# Altium project roverSwitch.PrjPcb (part 2 of 2)

## Sheet Power.SchDoc
size A4; DrawnBy: Emile Renaud; Revision: V1.0; SheetNumber: 2; SheetTotal: 8
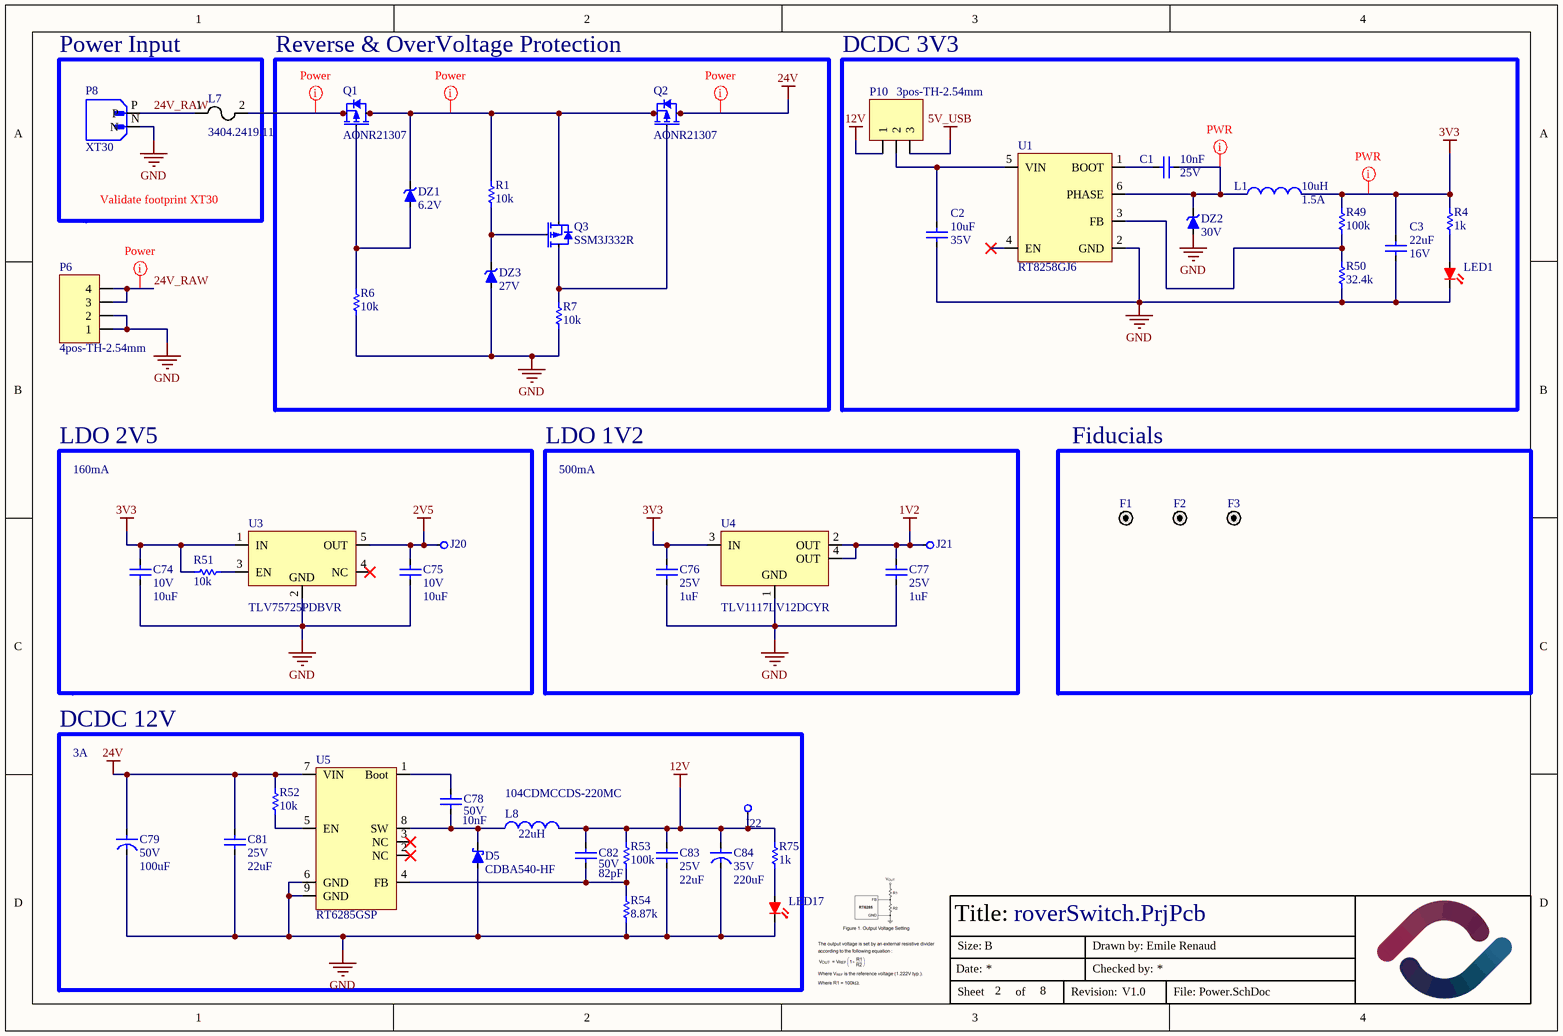
[diagram p6: Power.SchDoc]

### Parts
C1  value 10nF  Volt: 25V  [CAPACITOR-0603]  (hidden comment: Capacitor-0603-10nF-25V-X5R)
C2  value 10uF  Volt: 35V  [CAPACITOR-0805]  (hidden comment: Capacitor-0805-10uF-35V-X5R)
C3  value 22uF  Volt: 16V  [CAPACITOR-0805]  (hidden comment: Capacitor-0805-22uF-16V-X5R)
C74  value 10uF  Volt: 10V  [CAPACITOR-0603]  (hidden comment: Capacitor-0603-10uF-10V-X5R)
C75  value 10uF  Volt: 10V  [CAPACITOR-0603]  (hidden comment: Capacitor-0603-10uF-10V-X5R)
C76  value 1uF  Volt: 25V  [CAPACITOR-0603]  (hidden comment: Capacitor-0603-1uF-25V-X5R)
C77  value 1uF  Volt: 25V  [CAPACITOR-0603]  (hidden comment: Capacitor-0603-1uF-25V-X5R)
C78  value 10nF  Volt: 50V  [CAPACITOR-0603]  (hidden comment: Capacitor-0603-10nF-50V-X7R)
C79  value 100uF  Volt: 50V  [CAP_J-V_8X10P5_RUB]  (hidden comment: CAP ALUM 100UF 20% 25V SMD)
C81  value 22uF  Volt: 25V  [CAPACITOR-0805]  (hidden comment: Capacitor-0805-22uF-25V-X5R)
C82  value 82pF  Volt: 50V  [CAPACITOR-0603]  (hidden comment: Capacitor-0603-82pF-50V-C0G)
C83  value 22uF  Volt: 25V  [CAPACITOR-0805]  (hidden comment: Capacitor-0805-22uF-25V-X5R)
C84  value 220uF  Volt: 35V  [CAP_J-V_8X10P5_RUB]  (hidden comment: CAP ALUM 220UF 20% 35V SMD)
D5  CDBA540-HF  [SMA/DO-214AC]
DZ1  Volt: 6.2V  [SOD-123]  (hidden comment: BZT52C6V2-TP)
DZ2  Volt: 30V  [DO-219AD]  (hidden comment: MSS1P3L-M3/89A)
DZ3  Volt: 27V  [SOD-123F]  (hidden comment: MMSZ5254B-TP)
F1  F  [Fiducial_JLCPCB]  (value not drawn)
F2  F  [Fiducial_JLCPCB]  (value not drawn)
F3  F  [Fiducial_JLCPCB]  (value not drawn)
J20  hole  [PAD-0.53MM]  (value not drawn)  (no BOM)
J21  hole  [PAD-0.53MM]  (value not drawn)  (no BOM)
J22  hole  [PAD-0.53MM]  (value not drawn)  (no BOM)
L1  value 10uH  Current: 1.5A  [INDUCTOR_ASPI-4030S-100M]  (hidden comment: ASPI-4030S-100M-T)
L7  3404.2419.11  [2-SMD-Fuse]
L8  104CDMCCDS-220MC  value 22uH  [Inductor_22UH 5A]
LED1  B1911USD-20D000114U1930  [LED-0603-2PIN]  (value not drawn)
LED17  B1911USD-20D000114U1930  [LED-0603-2PIN]  (value not drawn)
P6  4pos-TH-2.54mm  [HDR1X4]
P8  XT30  [XT30PW_smd]
P10  3pos-TH-2.54mm  [HDR1X3]
Q1  AONR21307  [DFN8_3x3_Power]
Q2  AONR21307  [DFN8_3x3_Power]
Q3  SSM3J332R  [SOT-23-3]
R1  value 10k  [Resistor-0603]  (hidden comment: SMT resistor)
R4  value 1k  [Resistor-0603]  (hidden comment: SMT resistor)
R6  value 10k  [Resistor-0603]  (hidden comment: SMT resistor)
R7  value 10k  [Resistor-0603]  (hidden comment: SMT resistor)
R49  value 100k  [Resistor-0603]  (hidden comment: SMT resistor)
R50  value 32.4k  [Resistor-0603]  (hidden comment: SMT resistor)
R51  value 10k  [Resistor-0603]  (hidden comment: SMT resistor)
R52  value 10k  [Resistor-0603]  (hidden comment: SMT resistor)
R53  value 100k  [Resistor-0603]  (hidden comment: SMT resistor)
R54  value 8.87k  [Resistor-0603]  (hidden comment: SMT resistor)
R75  value 1k  [Resistor-0603]  (hidden comment: SMT resistor)
U1  RT8258GJ6  [SOT-23-6]
U3  TLV75725PDBVR  [SOT-23-5]
U4  TLV1117LV12DCYR  [SOT-223-3/TO-261-3S]
U5  RT6285GSP  [SOIC-8-EXPOSED-PAD]

### Blocks framed on the sheet
Power Input: L7 P8
Reverse & OverVoltage Protection: DZ1 DZ3 Q1-Q3 R1 R6 R7
DCDC 3V3: C1-C3 DZ2 L1 LED1 P10 R4 R49 R50 U1
LDO 2V5: C74 C75 J20 R51 U3
LDO 1V2: C76 C77 J21 U4
Fiducials: F1-F3
DCDC 12V: C78 C79 C81-C84 D5 J22 L8 LED17 R52-R54 R75 U5

### Nets
1V2: C77.2 J21.1 U4.2(OUT) U4.4(OUT)
2V5: C75.1 J20.1 U3.5(OUT)
3V3: C3.2 C74.1 C76.2 L1.2 R4.2 R49.2 R51.2 U3.1(IN) U4.3(IN)
5V_USB: P10.3
12V: C82.2 C83.2 C84.1 J22.1 L8.2 P10.1 R53.2 R75.2
24V: C79.1 C81.2 Q2.5(D) Q2.6(D) Q2.7(D) Q2.8(D) R52.2 U5.7(VIN)
GND: C2.1 C3.1 C74.2 C75.2 C76.1 C77.1 C79.2 C81.1 C83.1 C84.2 D5.1(A) DZ2.2(A) DZ3.1(A) LED1.1(K) LED17.1(K) P6.1 P6.2 P8.N R6.1 R7.1 R50.1 R54.1 U1.2(GND) U3.2(GND) U4.1(GND) U5.6(GND) U5.9(GND)
24V_RAW: L7.1 P6.3 P6.4 P8.P
NetC1_1: C1.1 U1.1(BOOT)
NetC1_2: C1.2 DZ2.1(K) L1.1 U1.6(PHASE)
NetC2_2: C2.2 P10.2 U1.5(VIN)
NetC78_1: C78.1 D5.2(K) L8.1 U5.8(SW)
NetC78_2: C78.2 U5.1(Boot)
NetC82_1: C82.1 R53.1 R54.2 U5.4(FB)
NetDZ1_1: DZ1.1(A) Q1.4(G) R6.2
NetDZ1_2: DZ1.2(K) Q1.5(D) Q1.6(D) Q1.7(D) Q1.8(D) Q2.1(S) Q2.2(S) Q2.3(S) Q3.2(S) R1.2
NetDZ3_2: DZ3.2(K) Q3.1(G) R1.1
NetL7_2: L7.2 Q1.1(S) Q1.2(S) Q1.3(S)
NetLED1_2: LED1.2(R) R4.1
NetLED17_2: LED17.2(R) R75.1
NetQ2_4: Q2.4(G) Q3.3(D) R7.2
NetR49_1: R49.1 R50.2 U1.3(FB)
NetR51_1: R51.1 U3.3(EN)
NetR52_1: R52.1 U5.5(EN)

Not connected (* = marked no-connect by the designer): U1 4(EN)*; U3 4(NC)*; U5 2(NC)* 3(NC)*

### Layout directives
net class Power: 3V3, 24V, 24V_RAW, NetC1_2, NetDZ1_2, NetL7_2

### Notes on the sheet
- Validate footprint XT30
- 160mA
- 500mA
- 3A
- Title:
- Date:
- Size:
- B
- Drawn by:
- Checked by:
- Sheet
- of
- Revision:
- File:

### Library data of the parts
C1 = Capacitor-0603-10nF-25V-X5R: 10000 pF ±10% 25V Ceramic Capacitor X5R 0603 (1608 Metric); Precision: X5R-10%; Mounted: Yes; Package / Case: Metric 1608 , EIA 0603; Supplier 1: Digikey; Supplier Part Number 1: 478-KGM15AR51E103KTCT-ND
C2 = Capacitor-0805-10uF-35V-X5R: Precision: X5R-10%; Package / Case: Metric 2012 , EIA 0805; Mounted: Yes; Supplier 1: Digi-Key; Supplier Part Number 1: 490-10515-1-ND; Supplier 2: Digi-Key; Supplier 3: Digi-Key; Supplier 4: Digi-Key
C3 = Capacitor-0805-22uF-16V-X5R: Precision: X5R-10%; Package / Case: Metric 2012 , EIA 0805; Mounted: Yes; Supplier 1: Digi-Key; Supplier Part Number 1: 1276-6780-1-ND; Supplier 2: Digi-Key; Supplier 3: Digi-Key; Supplier 4: Digi-Key
C74 C75 = Capacitor-0603-10uF-10V-X5R: 10 µF ±20% 10V Ceramic Capacitor X5R 0603 (1608 Metric); Supplier 1: Digikey; Supplier Part Number 1: 4713-GMC10X5R106M10NTCT-ND; Mounted: Yes; Package / Case: Metric 1608 , EIA 0603; Precision: 20%
C76 C77 = Capacitor-0603-1uF-25V-X5R: Precision: X5R-10%; Package / Case: Metric 1608, EIA 0603; Mounted: Yes; Supplier 1: Digi-Key; Supplier Part Number 1: 1276-1859-2-ND; Supplier 2: Digi-Key; Supplier Part Number 2: 1276-1942-2-ND
C78 = Capacitor-0603-10nF-50V-X7R: Precision: X7R-10%; Mounted: Yes; Package / Case: Metric 1608 , EIA 0603; Supplier 1: Digikey; Supplier Part Number 1: 490-4778-1-ND
C79 = Capacitor-100uF-50V-SMD: CAP ALUM 100UF 20% 50V SMD; Precision: 20%; Mounted: Yes; Supplier 1: Digi-Key; Supplier Part Number 1: 1189-1651-1-ND; Supplier 2: Digi-Key
C81 C83 = Capacitor-0805-22uF-25V-X5R: Precision: X5R-20%; Package / Case: Metric 2012 , EIA 0805; Mounted: Yes; Supplier 1: Digi-Key; Supplier Part Number 1: 490-12389-1-ND; Supplier 2: Digi-Key
C82 = Capacitor-0603-82pF-50V-C0G: Precision: C0G-5%; Package / Case: Metric 1608, EIA 0603; Mounted: Yes; Supplier 1: Digi-Key; Supplier Part Number 1: 478-KGM15ACG1H820JTCT-ND; Supplier 2: Digi-Key
C84 = Capacitor-220uF-35V-SMD: Precision: 20%; Mounted: Yes; Supplier 1: Digi-Key; Supplier Part Number 1: 1189-1651-1-ND; Supplier 2: Digi-Key
D5 = CDBA540-HF: DIODE SCHOTTKY 40V 5A SMA; Supplier 1: Digi-Key; Supplier Part Number 1: 641-1707-1-ND; Mounted: Yes; Package / Case: SMA; Volt: 40V
DZ1 = BZT52C6V2-TP: Zener Diode 6.2 V 200 mW ±6% Surface Mount SOD-123; Watt: 200mW; Grade: None; Package / Case: SOD-123; Supplier 1: Digi-Key; Supplier Part Number 1: BZT52C13-TPMSCT-ND; Mounted: Yes; Precision: 6%
DZ2 = MSS1P3L-M3/89A: Diode 30 V 1A Surface Mount MicroSMP (DO-219AD); Grade: None; Package / Case: DO-214AC, SMA; Supplier 1: Digi-Key; Supplier Part Number 1: MSS1P3L-M3/89AGICT-ND; Mounted: Yes
DZ3 = MMSZ5254B-TP: DIODE ZENER 27V 500MW SOD123; Watt: 0.5W; Precision: 5%; Grade: None; Package / Case: SOD-123; Supplier 1: Digi-Key; Supplier Part Number 1: MMSZ5254B-TPMSCT-ND; Mounted: Yes
F1-F3 = F?: Fiducial for JLCPCBA
J20-J22 = PAD 0.53mm AWG28-Solid: PAD for 28 AWG Solid Wire; Mounted: N/A
L1 = ASPI-4030S-100M-T: 10 µH Shielded Drum Core, Wirewound Inductor 1.5 A 100mOhm Nonstandard; Precision: 20%; Supplier 1: Digi-Key; Mounted: Yes; Supplier Part Number 1: 535-12314-2-ND; Package / Case: SMD
L7 = 3404.2419.11: 2 A 277 V AC 250 V DC Fuse Board Mount (Cartridge Style Excluded) Requires Holder, Surface Mount 2-SMD, Square End Block with Clip; Current: 2A; Supplier 1: Digi-Key; Mounted: Yes; Supplier Part Number 1: 486-2091-ND; Package / Case: SMD
L8 = 104CDMCCDS-220MC: FIXED IND 22UH 5A 66 MOHM SMD; Precision: 20%; Supplier 1: Digi-Key; Mounted: Yes; Supplier Part Number 1: 308-2498-1-ND; Package / Case: SMD; Current: 5A
LED1 LED17 = B1911USD-20D000114U1930: LED RED CLEAR 1608 SMD; Package / Case: 0603 (1608 Metric); Mounted: Yes; Supplier 1: Digi-Key; Supplier Part Number 1: 3147-B1911USD-20D000114U1930CT-ND
P6 = 4pos-TH-2.54mm: 4pos TH 2.54mm Header; Supplier 1: Digi-Key; Supplier Part Number 1: N/A; Mounted: Yes; Package / Case: TH; Volt: N/A
P8 = XT30_pcb: Supplier 1: Digi-Key; Mounted: Yes; Package / Case: TH; Volt: N/A
P10 = 3pos-TH-2.54mm: 3pos TH 2.54mm Header; Supplier 1: Digi-Key; Supplier Part Number 1: N/A; Mounted: Yes; Package / Case: TH; Volt: N/A
Q1 Q2 = AONR21307: MOSFET P-CH 30V 24A 8DFN; Supplier 1: Digi-Key; Supplier Part Number 1: 785-1796-2-ND; Volt: 30V; Package / Case: 8-DFN-EP (3x3); Mounted: Yes; Current: 24A
Q3 = SSM3J332R: P-Channel 30 V 6A (Ta) 1W (Ta) Surface Mount SOT-23F; Volt: 30V; Supplier 1: Digi-Key; Supplier Part Number 1: SSM3J332RLFCT-ND; Package / Case: SOT-523; Mounted: Yes; Current: 6A
R1 R6 R7 R51 = Resistor0603-10k: Precision: 1%; Watt: 0.1W; Mounted: Yes; Package / Case: Metric 1608, EIA 0603; Supplier 2: Digi-Key; Supplier 4: Digi-Key; Supplier Part Number 2: RMCF0603FT10K0TR-ND; Supplier 1: Digi-Key; Supplier 3: Digi-Key; Supplier Part Number 1: 311-10.0KHRTR-ND
R4 R75 = Resistor-0603-1k: Resistor0603-1k; Precision: 1%; Watt: 0.1W; Mounted: Yes; Package / Case: Metric 1608, EIA 0603; Supplier 1: Digi-Key; Supplier Part Number 1: 311-1.00KHRCT-ND
R49 R53 = Resistor-0603-100k: Resistor0603-100k; Precision: 1%; Watt: 0.1W; Mounted: Yes; Package / Case: Metric 1608, EIA 0603; Supplier 1: Digi-Key; Supplier Part Number 1: 311-100KHRCT-ND
R50 = Resistor-0603-32.4k: Resistor0603-32.4k; Precision: 1%; Watt: 0.1W; Mounted: Yes; Package / Case: Metric 1608, EIA 0603; Supplier 1: Digi-Key; Supplier Part Number 1: 311-32.4KHRCT-ND
R52 = Resistor-0603-10k: Resistor0603-10k; Precision: 1%; Watt: 0.1W; Mounted: Yes; Package / Case: Metric 1608, EIA 0603; Supplier 1: Digi-Key; Supplier Part Number 1: 311-10.0KHRTR-ND
R54 = Resistor-0603-8.87k: Resistor0603-8.87k; Precision: 1%; Watt: 0.1W; Mounted: Yes; Package / Case: Metric 1608, EIA 0603; Supplier 1: Digi-Key; Supplier Part Number 1: 311-8.87KHRCT-ND
U1 = REG_SWR_RT8258GJ6: Switching Regulator/Controller; Manufacturer: Richtek; Supplier: Mouser; Supplier Part Number: 835-RT8258GJ6; Manufacturer Part Number: RT8258GJ6; RoHS: Yes; Category: Voltage Regulators - Switching; Stock: 6840; Pricing: 1=0,64, 10=0,566, 50=0,566, 100=0,434, 1000=0,274, 10000=0,223 (USD); ComponentLink1URL: https://datasheet.ciiva.com:443/pdfs/VipMasterIC/IC/RHTK/RHTKS00677/RHTKS00677-1.pdf?src-supplier=IHS+Markit; ComponentLink1Description: https://datasheet.ciiva.com:443/pdfs/VipMasterIC/IC/RHTK/RHTKS00677/RHTKS00677-1.pdf?src-supplier=IHS+Markit; ComponentLink2URL: https://datasheet.ciiva.com/2035/3d3futf-83fb3frfm4mju4ltaylnbkzg3d3d3f3d-2035878.pdf?src-supplier=Digikey; ComponentLink2Description: https://datasheet.ciiva.com/2035/3d3futf-83fb3frfm4mju4ltaylnbkzg3d3d3f3d-2035878.pdf?src-supplier=Digikey; ComponentLink3URL: https://datasheet.ciiva.com/22686/1720507-22686356.pdf?src-supplier=Element14; ComponentLink3Description: https://datasheet.ciiva.com/22686/1720507-22686356.pdf?src-supplier=Element14
U3 = TLV75725PDBVR: IC REG 2.5V Positive Fixed 1 Output 1A SOT-23-5; Supplier 1: Digi-Key; Supplier Part Number 1: 296-50412-1-ND; Package / Case: SOT23-5; Mounted: Yes
U4 = TLV1117LV12DCYR: IC REG 1.2V LINEAR 1A SOT223; Supplier 1: Digi-Key; Supplier Part Number 1: 296-TLV1117LV12DCYRCT-ND; Package / Case: SOT223; Mounted: Yes
U5 = RT6285GSP: 5A Buck Switching Regulator IC Positive Adjustable 1.222V 1 Output 5A 8-SOIC (0.154", 3.90mm Width) Exposed Pad; Grade: None; Supplier 1: Digi-Key; Supplier Part Number 1: 1028-RT6285GSPCT-ND; HelpURL: file:///C:/Users/Emile/Downloads/DS6285-00.pdf; Package / Case: 8-SOIC-EP; Mounted: Yes

## Sheet CAN-SW.SchDoc
size A4; DrawnBy: Emile Renaud; Revision: V1.0; SheetNumber: 4; SheetTotal: 8
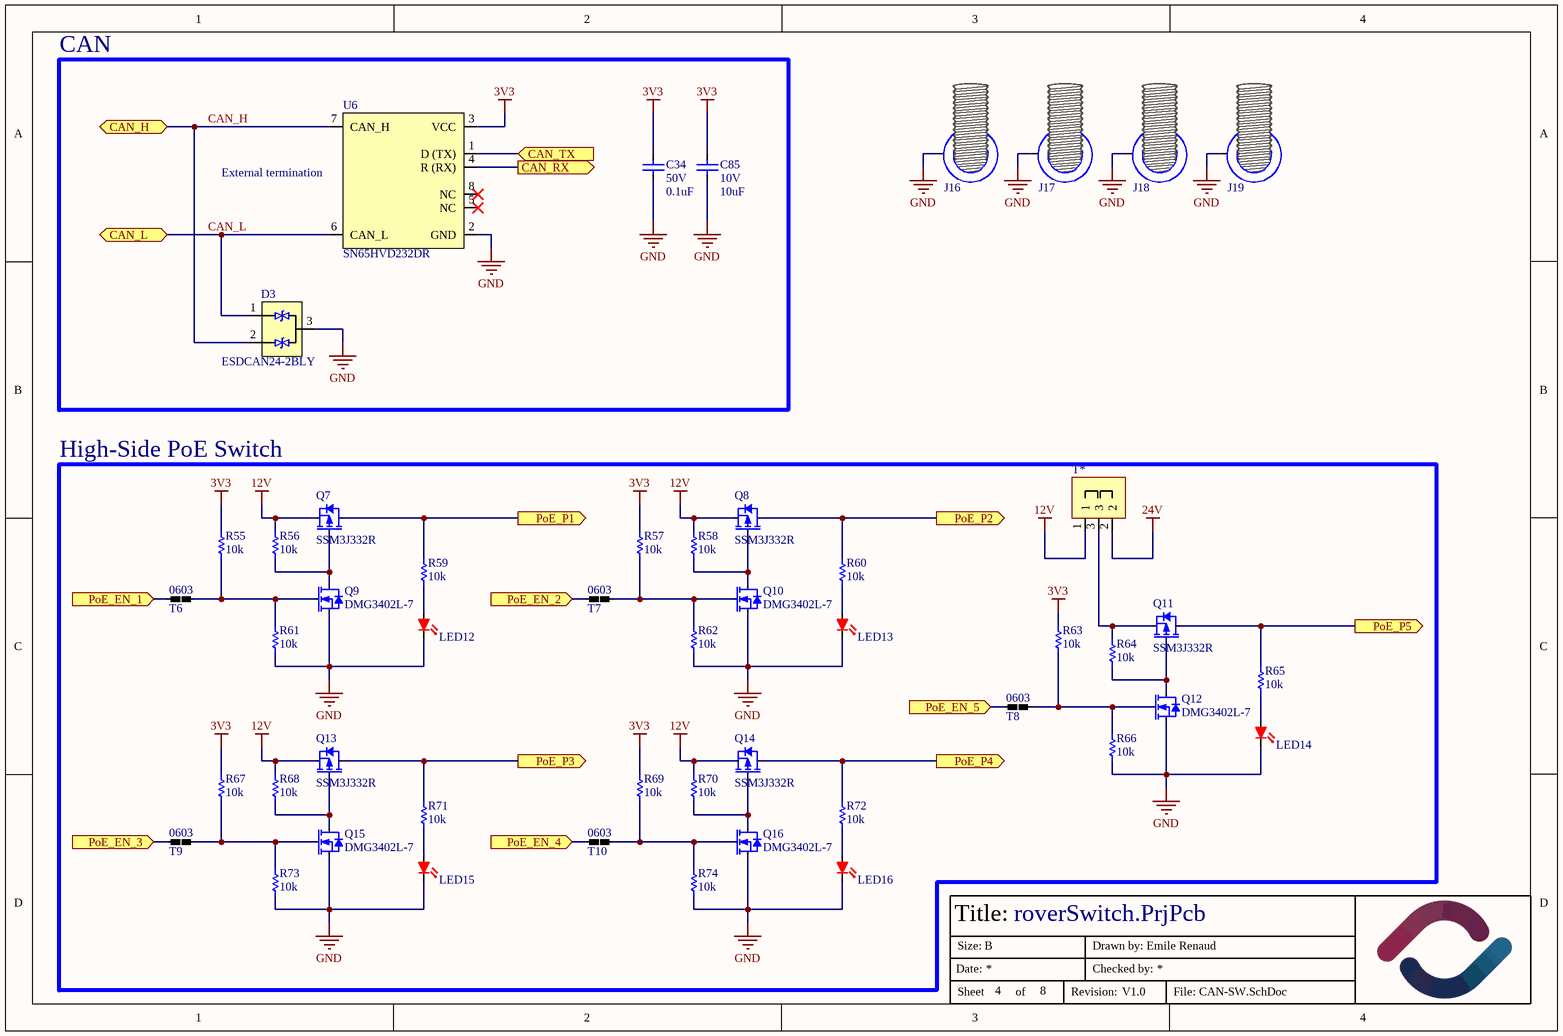
[diagram p7: CAN-SW.SchDoc]

### Parts
C34  value 0.1uF  Volt: 50V  [CAPACITOR-0603]  (hidden comment: Capacitor-0603-0.1uF-50V-X7R)
C85  value 10uF  Volt: 10V  [CAPACITOR-0603]  (hidden comment: Capacitor-0603-10uF-10V-X5R)
D3  ESDCAN24-2BLY  [SOT-23-3]
J16  hole  [HOLE-3.40MM-M3-8MMEYELET]  (value not drawn)  (no BOM)
J17  hole  [HOLE-3.40MM-M3-8MMEYELET]  (value not drawn)  (no BOM)
J18  hole  [HOLE-3.40MM-M3-8MMEYELET]  (value not drawn)  (no BOM)
J19  hole  [HOLE-3.40MM-M3-8MMEYELET]  (value not drawn)  (no BOM)
LED12  B1911USD-20D000114U1930  [LED-0603-2PIN]  (value not drawn)
LED13  B1911USD-20D000114U1930  [LED-0603-2PIN]  (value not drawn)
LED14  B1911USD-20D000114U1930  [LED-0603-2PIN]  (value not drawn)
LED15  B1911USD-20D000114U1930  [LED-0603-2PIN]  (value not drawn)
LED16  B1911USD-20D000114U1930  [LED-0603-2PIN]  (value not drawn)
Q7  SSM3J332R  [SOT-23-3]
Q8  SSM3J332R  [SOT-23-3]
Q9  DMG3402L-7  [SOT-23-3]
Q10  DMG3402L-7  [SOT-23-3]
Q11  SSM3J332R  [SOT-23-3]
Q12  DMG3402L-7  [SOT-23-3]
Q13  SSM3J332R  [SOT-23-3]
Q14  SSM3J332R  [SOT-23-3]
Q15  DMG3402L-7  [SOT-23-3]
Q16  DMG3402L-7  [SOT-23-3]
R55  value 10k  [Resistor-0603]  (hidden comment: SMT resistor)
R56  value 10k  [Resistor-0603]  (hidden comment: SMT resistor)
R57  value 10k  [Resistor-0603]  (hidden comment: SMT resistor)
R58  value 10k  [Resistor-0603]  (hidden comment: SMT resistor)
R59  value 10k  [Resistor-0603]  (hidden comment: SMT resistor)
R60  value 10k  [Resistor-0603]  (hidden comment: SMT resistor)
R61  value 10k  [Resistor-0603]  (hidden comment: SMT resistor)
R62  value 10k  [Resistor-0603]  (hidden comment: SMT resistor)
R63  value 10k  [Resistor-0603]  (hidden comment: SMT resistor)
R64  value 10k  [Resistor-0603]  (hidden comment: SMT resistor)
R65  value 10k  [Resistor-0603]  (hidden comment: SMT resistor)
R66  value 10k  [Resistor-0603]  (hidden comment: SMT resistor)
R67  value 10k  [Resistor-0603]  (hidden comment: SMT resistor)
R68  value 10k  [Resistor-0603]  (hidden comment: SMT resistor)
R69  value 10k  [Resistor-0603]  (hidden comment: SMT resistor)
R70  value 10k  [Resistor-0603]  (hidden comment: SMT resistor)
R71  value 10k  [Resistor-0603]  (hidden comment: SMT resistor)
R72  value 10k  [Resistor-0603]  (hidden comment: SMT resistor)
R73  value 10k  [Resistor-0603]  (hidden comment: SMT resistor)
R74  value 10k  [Resistor-0603]  (hidden comment: SMT resistor)
T6  NetTie_0603_Short  [NetTie-0603-short]  (value not drawn)
T7  NetTie_0603_Short  [NetTie-0603-short]  (value not drawn)
T8  NetTie_0603_Short  [NetTie-0603-short]  (value not drawn)
T9  NetTie_0603_Short  [NetTie-0603-short]  (value not drawn)
T10  NetTie_0603_Short  [NetTie-0603-short]  (value not drawn)
T*  Jumper-3pos-small  [Jumper-3pos-small]  (value not drawn)
U6  SN65HVD232DR  [SOIC-8]

### Blocks framed on the sheet
CAN: C34 C85 D3 U6
High-Side PoE Switch: LED12-LED16 Q7-Q16 R55-R74 T6-T10 T*

### Ports
CAN_H (bidir), CAN_L (bidir), CAN_RX (out), CAN_TX (in), PoE_EN_1 (in), PoE_EN_2 (in), PoE_EN_3 (in), PoE_EN_4 (in), PoE_EN_5 (in), PoE_P1 (out), PoE_P2 (out), PoE_P3 (out), PoE_P4 (out), PoE_P5 (out)

### Nets
3V3: C34.2 C85.2 R55.2 R57.2 R63.2 R67.2 R69.2 U6.3(VCC)
12V: Q7.2(S) Q8.2(S) Q13.2(S) Q14.2(S) R56.2 R58.2 R68.2 R70.2 T*.1
24V: T*.2
GND: C34.1 C85.1 D3.3(L3) J16.1 J17.1 J18.1 J19.1 LED12.1(K) LED13.1(K) LED14.1(K) LED15.1(K) LED16.1(K) Q9.2(S) Q10.2(S) Q12.2(S) Q15.2(S) Q16.2(S) R61.1 R62.1 R66.1 R73.1 R74.1 U6.2(GND)
CAN_H: D3.2(GND) U6.7(CAN_H) ; port CAN_H
CAN_L: D3.1(L2) U6.6(CAN_L) ; port CAN_L
CAN_RX: U6.4(R_(RX)) ; port CAN_RX
CAN_TX: U6.1(D_(TX)) ; port CAN_TX
PoE_EN_1: T6.2 ; port PoE_EN_1
PoE_EN_2: T7.2 ; port PoE_EN_2
PoE_EN_3: T9.2 ; port PoE_EN_3
PoE_EN_4: T10.2 ; port PoE_EN_4
PoE_EN_5: T8.2 ; port PoE_EN_5
PoE_P1: Q7.3(D) R59.2 ; port PoE_P1
PoE_P2: Q8.3(D) R60.2 ; port PoE_P2
PoE_P3: Q13.3(D) R71.2 ; port PoE_P3
PoE_P4: Q14.3(D) R72.2 ; port PoE_P4
PoE_P5: Q11.3(D) R65.2 ; port PoE_P5
NetLED12_2: LED12.2(R) R59.1
NetLED13_2: LED13.2(R) R60.1
NetLED14_2: LED14.2(R) R65.1
NetLED15_2: LED15.2(R) R71.1
NetLED16_2: LED16.2(R) R72.1
NetQ7_1: Q7.1(G) Q9.3(D) R56.1
NetQ8_1: Q8.1(G) Q10.3(D) R58.1
NetQ9_1: Q9.1(G) R55.1 R61.2 T6.1
NetQ10_1: Q10.1(G) R57.1 R62.2 T7.1
NetQ11_1: Q11.1(G) Q12.3(D) R64.1
NetQ11_2: Q11.2(S) R64.2 T*.3
NetQ12_1: Q12.1(G) R63.1 R66.2 T8.1
NetQ13_1: Q13.1(G) Q15.3(D) R68.1
NetQ14_1: Q14.1(G) Q16.3(D) R70.1
NetQ15_1: Q15.1(G) R67.1 R73.2 T9.1
NetQ16_1: Q16.1(G) R69.1 R74.2 T10.1

Not connected (* = marked no-connect by the designer): U6 5(NC)* 8(NC)*

### Notes on the sheet
- (near U6) External termination
- Title:
- Date:
- Size:
- B
- Drawn by:
- Checked by:
- Sheet
- of
- Revision:
- File:
- (in symbol NetTie_0603_Short) 0603

### Library data of the parts
C34 = Capacitor-0603-0.1uF-50V-X7R: Precision: X7R-10%; Package / Case: Metric 1608, EIA 0603; Mounted: Yes; Supplier 1: Digi-Key; Supplier Part Number 1: 1276-1935-2-ND; Supplier 2: Digi-Key; Supplier Part Number 2: 1276-1934-2-ND
C85 = Capacitor-0603-10uF-10V-X5R: as C74 on sheet Power; Supplier 1: Digikey; Supplier Part Number 1: 4713-GMC10X5R106M10NTCT-ND; Mounted: Yes; Package / Case: Metric 1608 , EIA 0603; Precision: 20%
D3 = ESDCAN24-2BLY: 55V Clamp 6A (8/20µs) Ipp Tvs Diode Surface Mount SOT-23; Volt: 24; Supplier 1: Digi-Key; Supplier Part Number 1: 5272-ESDCAN24-2BLYCT-ND; Mounted: Yes; Package / Case: SOT-23-3
J16-J19 = Hole 3.40mm M3-Eyelet: Hole for M3 Bolt with 8mm pad; Mounted: N/A
LED12-LED16 = B1911USD-20D000114U1930: LED RED CLEAR 0603 SMD; Package / Case: 0603 (1608 Metric); Mounted: Yes; Supplier 1: Digi-Key; Supplier Part Number 1: 3147-B1911USD-20D000114U1930CT-ND
Q7 Q8 Q11 Q13 Q14 = SSM3J332R: as Q3 on sheet Power; Supplier 1: Digi-Key; Supplier Part Number 1: SSM3J332RLFCT-ND; Package / Case: SOT-523; Mounted: Yes; Current: 6A
Q9 Q10 Q12 Q15 Q16 = DMG3402L-7: N-Channel 30 V 4A (Ta) 1.4W (Ta) Surface Mount SOT-23-3; Volt: 30V; Supplier 1: Digi-Key; Supplier Part Number 1: DMG3402L-7DICT-ND; Package / Case: SOT-23-3; Mounted: Yes; Current: 4A
R55-R74 = Resistor-0603-10k: as R52 on sheet Power; Mounted: Yes; Package / Case: Metric 1608, EIA 0603; Supplier 1: Digi-Key; Supplier Part Number 1: 311-10.0KHRTR-ND
U6 = SN65HVD232DR: 1/1 Transceiver Half CANbus 8-SOIC; Package / Case: 8-SOIC; Mounted: Yes; Supplier 1: Digikey; Supplier Part Number 1: 296-26344-1-ND; HelpURL: https://www.ti.com/lit/ds/symlink/sn65hvd230.pdf?HQS=dis-dk-null-digikeymode-dsf-pf-null-wwe&ts=1723930967656&ref_url=https%253A%252F%252Fwww.ti.com%252Fgeneral%252Fdocs%252Fsuppproductinfo.tsp%253FdistId%253D10%2526gotoUrl%253Dhttps%253A%252F%252Fwww.ti.com%252Flit%252Fgpn%252Fsn65hvd230

## Nets that join several sheets
1V2: KSZ_Switch_Control (21 pins), Power (C77.2 J21.1 U4.2 U4.4)
2V5: KSZ_Switch_Control (L2.1 L3.1), Power (C75.1 J20.1 U3.5)
3V3: Connectors_2 (R5.1 R8.1), KSZ_Switch_Control (12 pins), Connectors_1 (8 pins), ESP32 (18 pins), Power (9 pins), CAN-SW (8 pins)
5V_USB: ESP32 (D4.5 P7.1), Power (P10.3)
12V: Power (8 pins), CAN-SW (9 pins)
24V: Connectors_2 (P3.5 P3.7 P4.2), Power (8 pins), CAN-SW (T*.2)
GND: Connectors_2 (17 pins), KSZ_Switch (13 pins), KSZ_Switch_Control (55 pins), Connectors_1 (18 pins), ESP32 (30 pins), Power (27 pins), CAN-SW (23 pins)
CAN_H: Connectors_2 (P3.1 P4.4), CAN-SW (D3.2 U6.7)
CAN_L: Connectors_2 (P3.2 P4.3), CAN-SW (D3.1 U6.6)
CAN_RX: ESP32 (U7.19), CAN-SW (U6.4)
CAN_TX: ESP32 (U7.18), CAN-SW (U6.1)
P1_G_LED: KSZ_Switch (R14.2 U2.106), Connectors_1 (LED2.1)
P1_Y_LED: KSZ_Switch (R13.2 U2.105), Connectors_1 (LED3.1)
P2_G_LED: KSZ_Switch (R16.2 U2.92), Connectors_1 (LED4.1)
P2_Y_LED: KSZ_Switch (R15.2 U2.91), Connectors_1 (LED7.1)
P3_G_LED: KSZ_Switch (R17.2 U2.89), Connectors_1 (LED8.1)
P3_Y_LED: KSZ_Switch (U2.88), Connectors_1 (LED9.1)
P4_G_LED: KSZ_Switch (R20.2 U2.86), Connectors_1 (LED10.1)
P4_Y_LED: KSZ_Switch (R19.2 U2.85), Connectors_1 (LED11.1)
P5_G_LED: Connectors_2 (P2.9), KSZ_Switch (R21.2 U2.103)
P5_Y_LED: Connectors_2 (P2.11), KSZ_Switch (U2.102)
PHY_RX_1_N: KSZ_Switch (U2.5), Connectors_1 (Q5.8)
PHY_RX_1_P: KSZ_Switch (U2.4), Connectors_1 (Q5.6)
PHY_RX_2_N: KSZ_Switch (U2.16), Connectors_1 (Q6.8)
PHY_RX_2_P: KSZ_Switch (U2.15), Connectors_1 (Q6.6)
PHY_RX_3_N: KSZ_Switch (U2.27), Connectors_1 (Q17.8)
PHY_RX_3_P: KSZ_Switch (U2.26), Connectors_1 (Q17.6)
PHY_RX_4_N: KSZ_Switch (U2.38), Connectors_1 (Q18.8)
PHY_RX_4_P: KSZ_Switch (U2.37), Connectors_1 (Q18.6)
PHY_RX_5_N: Connectors_2 (Q4.8), KSZ_Switch (U2.116)
PHY_RX_5_P: Connectors_2 (Q4.6), KSZ_Switch (U2.115)
PHY_TX_1_N: KSZ_Switch (U2.2), Connectors_1 (Q5.3)
PHY_TX_1_P: KSZ_Switch (U2.1), Connectors_1 (Q5.1)
PHY_TX_2_N: KSZ_Switch (U2.13), Connectors_1 (Q6.3)
PHY_TX_2_P: KSZ_Switch (U2.12), Connectors_1 (Q6.1)
PHY_TX_3_N: KSZ_Switch (U2.25), Connectors_1 (Q17.3)
PHY_TX_3_P: KSZ_Switch (U2.24), Connectors_1 (Q17.1)
PHY_TX_4_N: KSZ_Switch (U2.35), Connectors_1 (Q18.3)
PHY_TX_4_P: KSZ_Switch (U2.34), Connectors_1 (Q18.1)
PHY_TX_5_N: Connectors_2 (Q4.3), KSZ_Switch (U2.113)
PHY_TX_5_P: Connectors_2 (Q4.1), KSZ_Switch (U2.112)
PoE_EN_1: ESP32 (U7.11), CAN-SW (T6.2)
PoE_EN_2: ESP32 (U7.12), CAN-SW (T7.2)
PoE_EN_3: ESP32 (U7.13), CAN-SW (T9.2)
PoE_EN_4: ESP32 (U7.14), CAN-SW (T10.2)
PoE_EN_5: ESP32 (U7.15), CAN-SW (T8.2)
PoE_P1: Connectors_1 (P5.A4 P5.A5), CAN-SW (Q7.3 R59.2)
PoE_P2: Connectors_1 (P5.B4 P5.B5), CAN-SW (Q8.3 R60.2)
PoE_P3: Connectors_1 (P5.C4 P5.C5), CAN-SW (Q13.3 R71.2)
PoE_P4: Connectors_1 (P5.D4 P5.D5), CAN-SW (Q14.3 R72.2)
PoE_P5: Connectors_2 (P2.4 P2.5), CAN-SW (Q11.3 R65.2)
RESET_N: Connectors_2 (P1.3 P11.3), KSZ_Switch_Control (5 pins)
RX1: Connectors_2 (P1.2 P11.1), ESP32 (U7.39)
S_RX_7_N: Connectors_2 (P1.5 P11.11), KSZ_Switch (U2.78)
S_RX_7_P: Connectors_2 (P1.7 P11.9), KSZ_Switch (U2.79)
S_TX_7_N: Connectors_2 (P1.11 P11.5), KSZ_Switch (U2.82)
S_TX_7_P: Connectors_2 (P1.9 P11.7), KSZ_Switch (U2.81)
SPI_CLK: KSZ_Switch (U2.101), ESP32 (U7.43)
SPI_CS: KSZ_Switch (U2.100), ESP32 (U7.42)
SPI_MISO: KSZ_Switch (U2.97), ESP32 (U7.40)
SPI_MOSI: KSZ_Switch (U2.98), ESP32 (U7.41)
TX1: Connectors_2 (P1.1 P11.2), ESP32 (U7.38)

## Assembly variants
JLCPBCB_Prod: not fitted DZ3 L7 P1 P11 Q1 Q2 Q3 R1 R6 R7